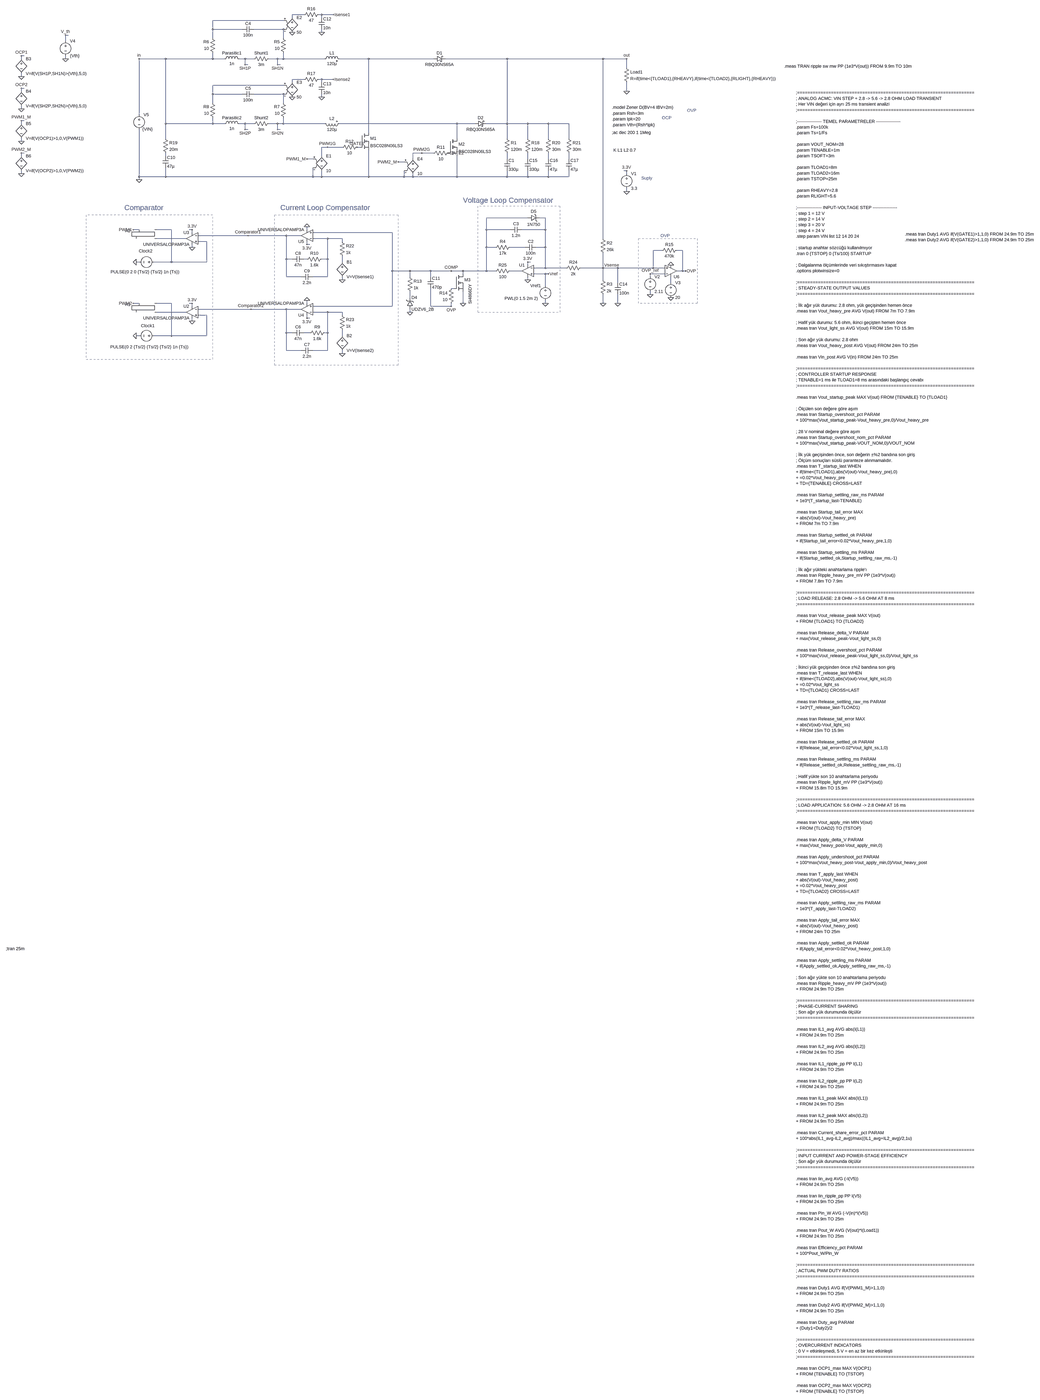
[diagram p0: schematic Konferans ACMC.asc, whole sheet]
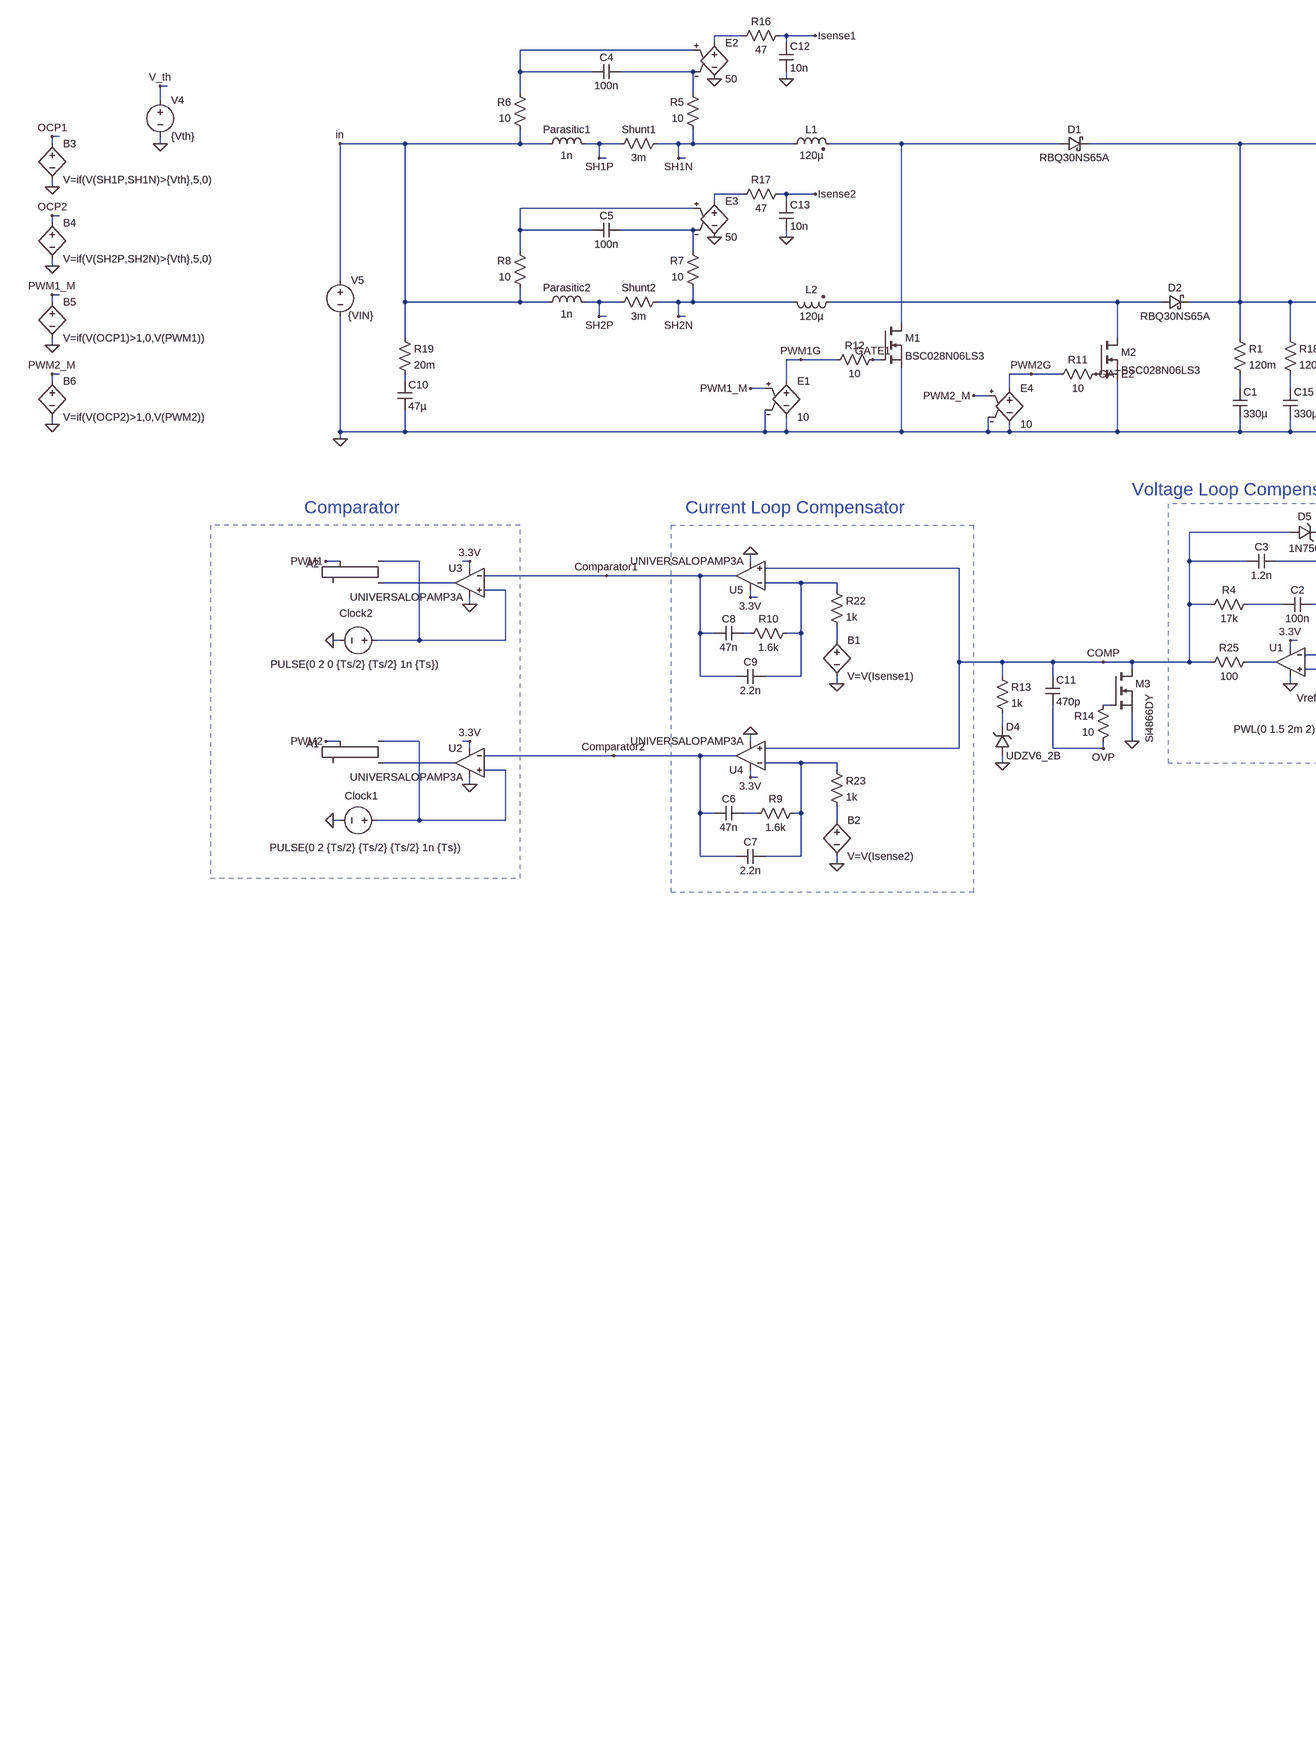
[diagram p1: schematic Konferans ACMC.asc, part, row 1 of 2, column 1 of 2]
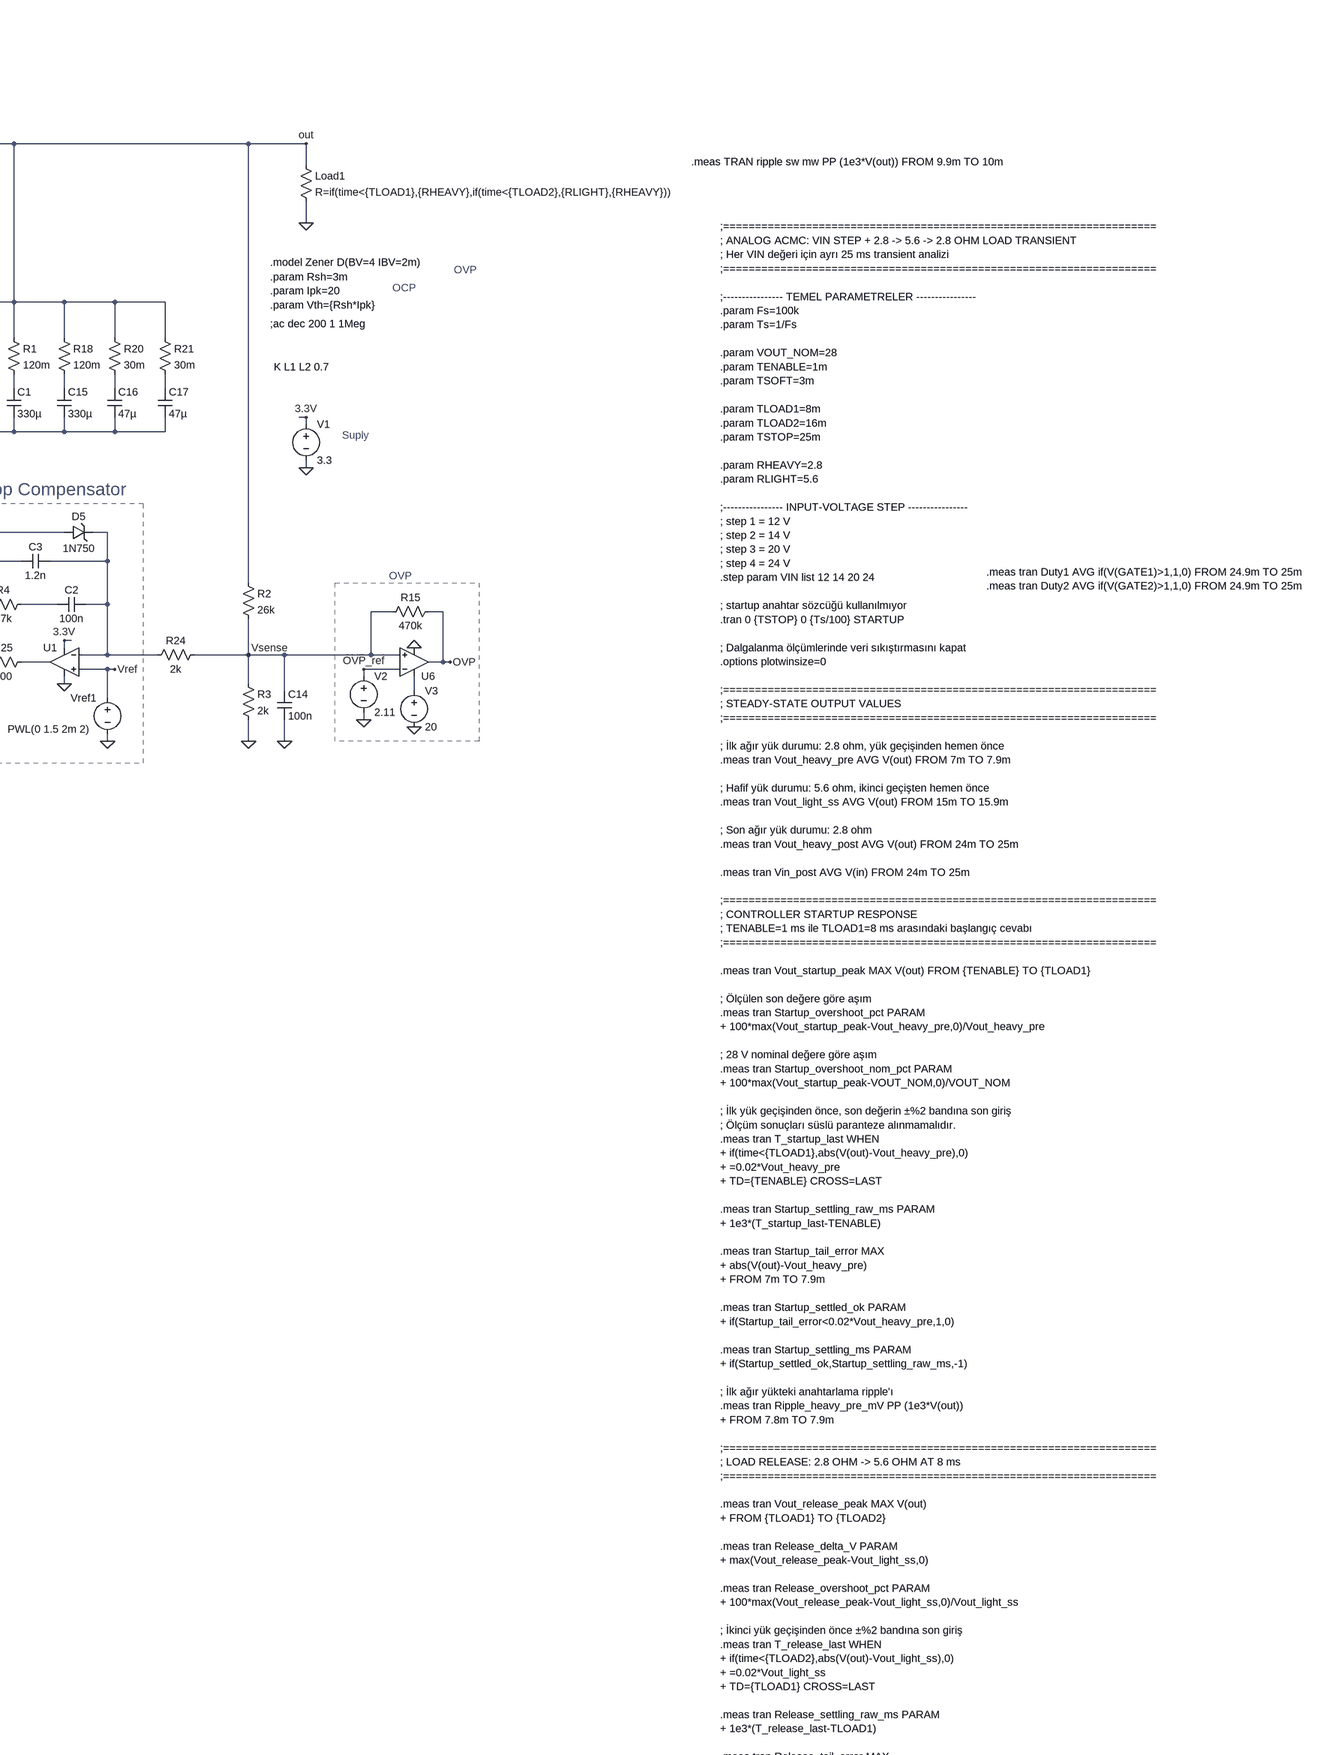
[diagram p2: schematic Konferans ACMC.asc, part, row 1 of 2, column 2 of 2]
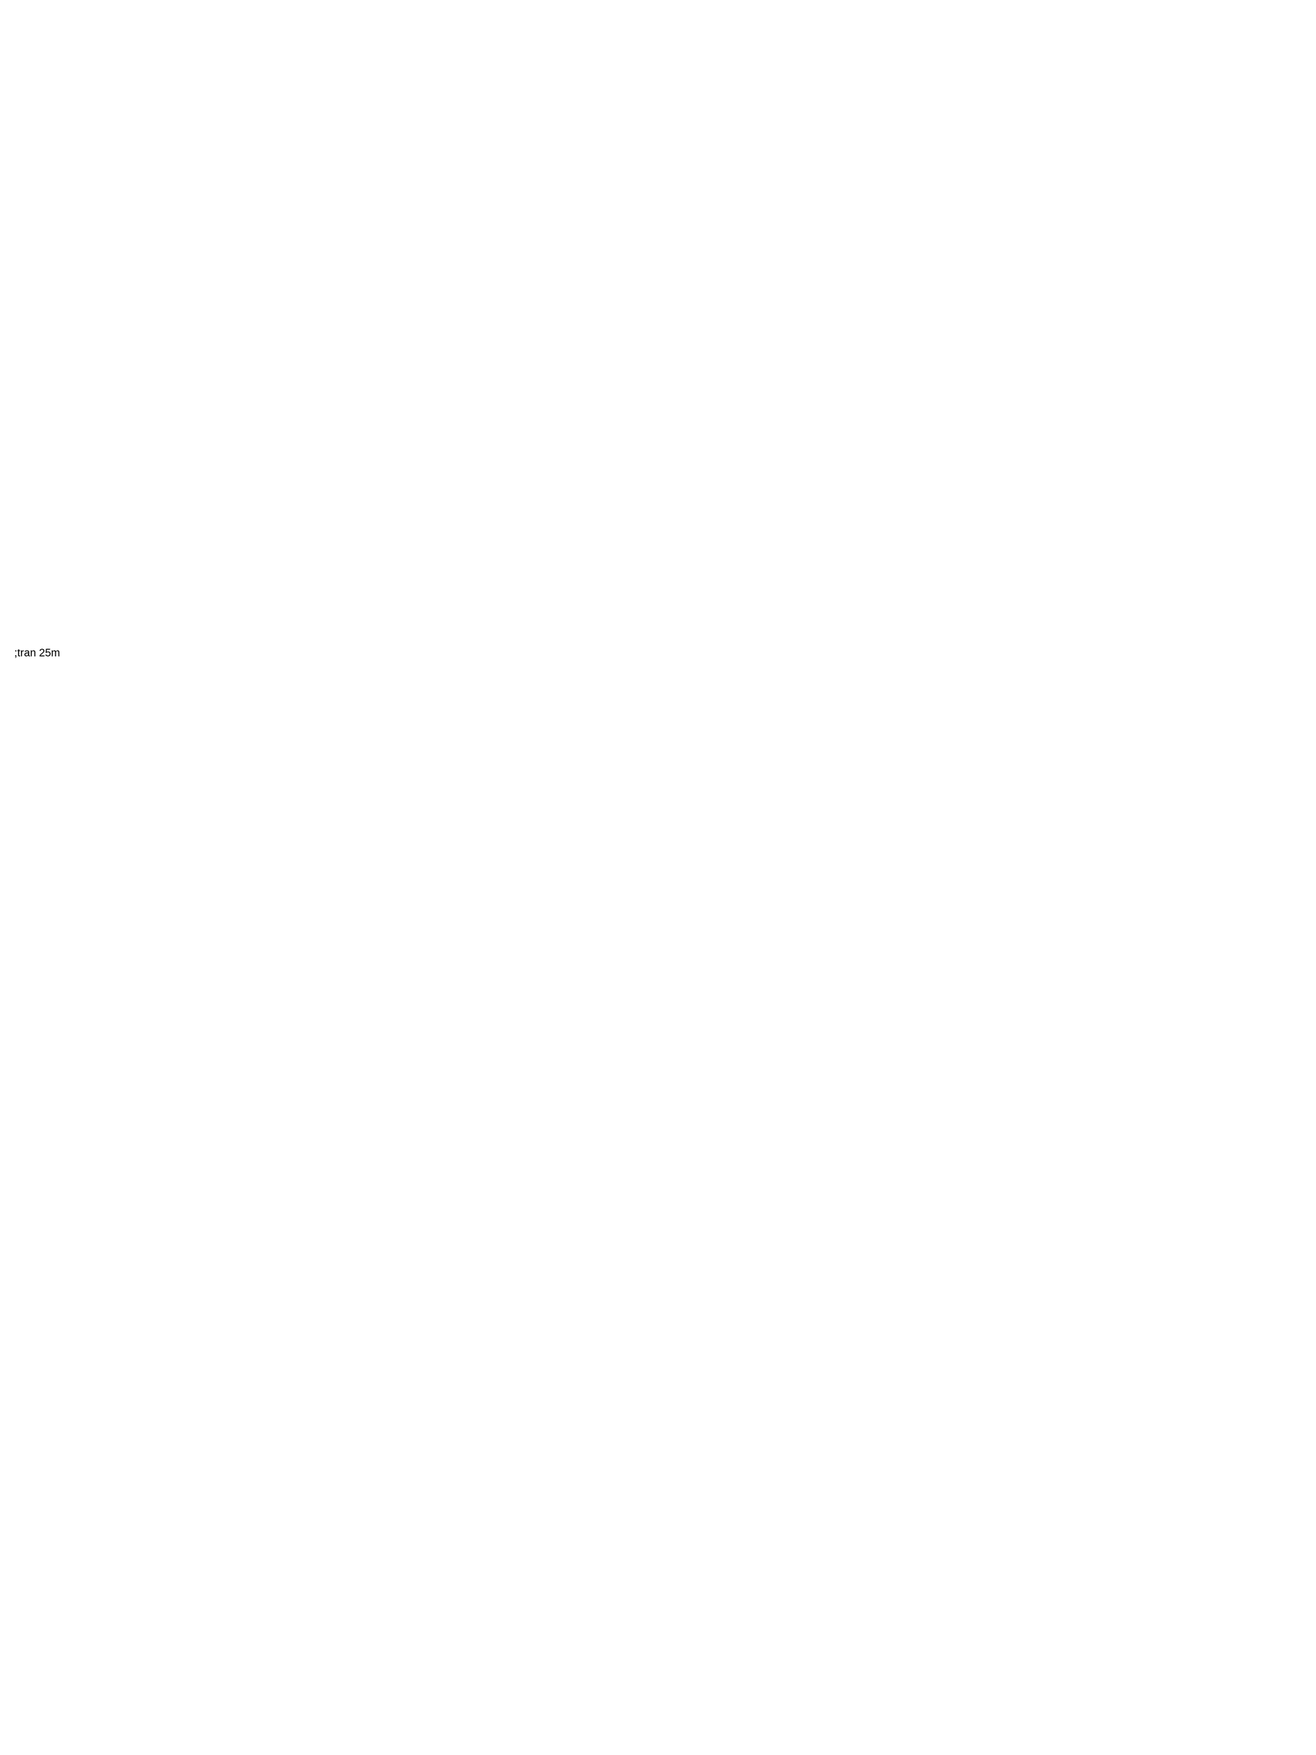
[diagram p3: schematic Konferans ACMC.asc, part, row 2 of 2, column 1 of 2]
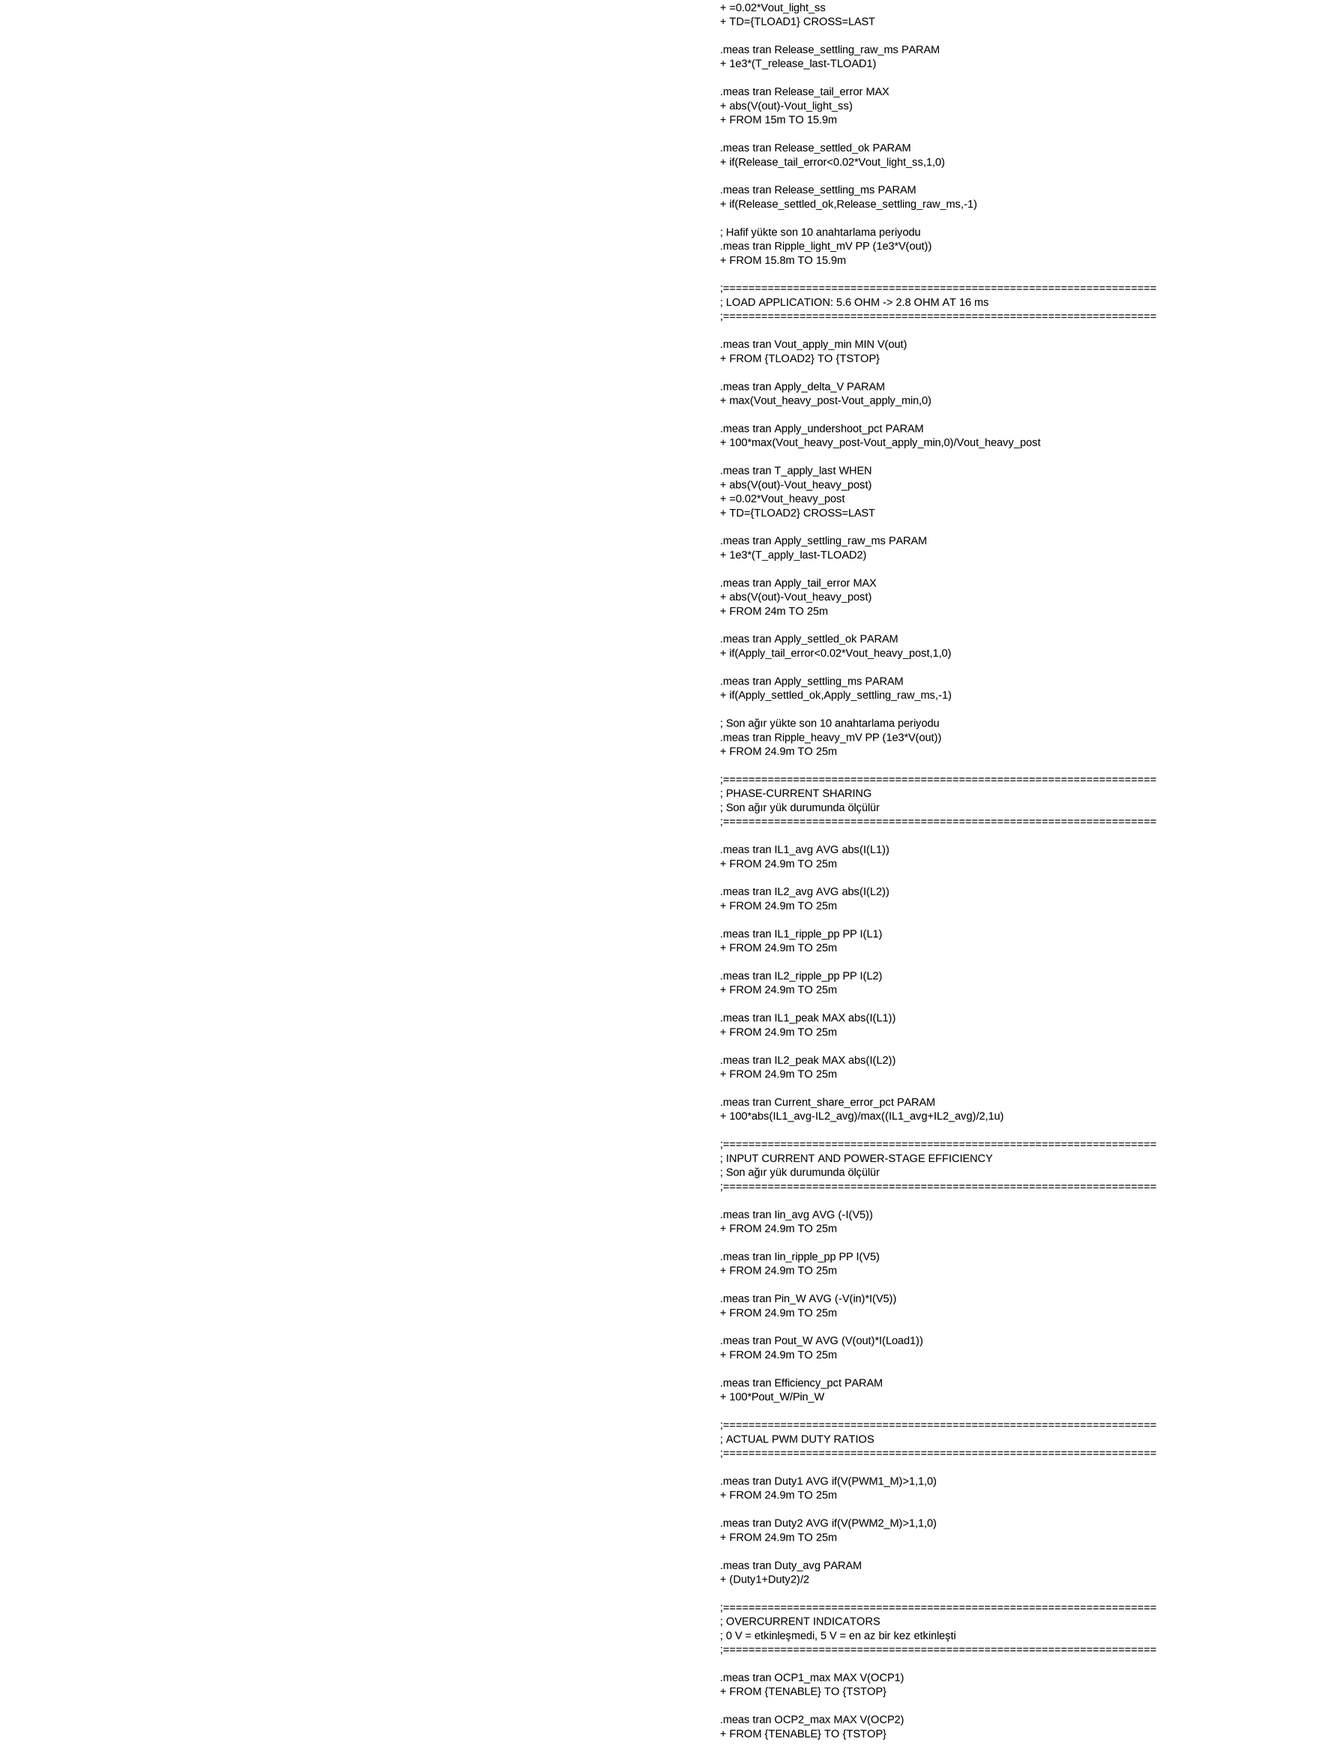
[diagram p4: schematic Konferans ACMC.asc, part, row 2 of 2, column 2 of 2]
Konferans ACMC.asc, the LTspice schematic file:
Version 4
SHEET 1 4208 6960
WIRE -80 -1168 -144 -1168
WIRE 16 -1168 0 -1168
WIRE 80 -1168 16 -1168
WIRE -144 -1152 -144 -1168
WIRE 16 -1152 16 -1168
WIRE -192 -1136 -576 -1136
WIRE -576 -1088 -576 -1136
WIRE -416 -1088 -576 -1088
WIRE -192 -1088 -352 -1088
WIRE 16 -1072 16 -1088
WIRE -1360 -1056 -1376 -1056
WIRE -576 -1040 -576 -1088
WIRE -192 -1040 -192 -1088
WIRE -1376 -1024 -1376 -1056
WIRE -1600 -944 -1616 -944
WIRE -1616 -928 -1616 -944
WIRE -1376 -928 -1376 -944
WIRE -832 -928 -976 -928
WIRE -576 -928 -576 -960
WIRE -576 -928 -832 -928
WIRE -512 -928 -576 -928
WIRE -400 -928 -432 -928
WIRE -352 -928 -400 -928
WIRE -224 -928 -272 -928
WIRE -192 -928 -192 -960
WIRE -192 -928 -224 -928
WIRE 32 -928 -192 -928
WIRE 272 -928 112 -928
WIRE 624 -928 272 -928
WIRE 1024 -928 688 -928
WIRE 1552 -928 1024 -928
WIRE 1680 -928 1552 -928
WIRE -400 -896 -400 -928
WIRE -384 -896 -400 -896
WIRE -224 -896 -224 -928
WIRE -208 -896 -224 -896
WIRE 1680 -880 1680 -928
WIRE -1616 -832 -1616 -848
WIRE -80 -816 -144 -816
WIRE 16 -816 0 -816
WIRE 80 -816 16 -816
WIRE -144 -800 -144 -816
WIRE 16 -800 16 -816
WIRE -192 -784 -576 -784
WIRE -1600 -768 -1616 -768
WIRE -1616 -752 -1616 -768
WIRE 1680 -752 1680 -800
WIRE -576 -736 -576 -784
WIRE -416 -736 -576 -736
WIRE -192 -736 -352 -736
WIRE 16 -720 16 -736
WIRE -576 -688 -576 -736
WIRE -192 -688 -192 -736
WIRE -1616 -656 -1616 -672
WIRE -976 -624 -976 -928
WIRE -1600 -592 -1616 -592
WIRE -1616 -576 -1616 -592
WIRE -832 -576 -832 -928
WIRE -576 -576 -576 -608
WIRE -576 -576 -832 -576
WIRE -512 -576 -576 -576
WIRE -400 -576 -432 -576
WIRE -352 -576 -400 -576
WIRE -224 -576 -272 -576
WIRE -192 -576 -192 -608
WIRE -192 -576 -224 -576
WIRE 32 -576 -192 -576
WIRE 752 -576 112 -576
WIRE 848 -576 752 -576
WIRE 1024 -576 1024 -928
WIRE 1024 -576 912 -576
WIRE 1136 -576 1024 -576
WIRE 1248 -576 1136 -576
WIRE 1360 -576 1248 -576
WIRE -400 -544 -400 -576
WIRE -384 -544 -400 -544
WIRE -224 -544 -224 -576
WIRE -208 -544 -224 -544
WIRE 272 -528 272 -928
WIRE -832 -496 -832 -576
WIRE 752 -496 752 -576
WIRE 1024 -496 1024 -576
WIRE 1136 -496 1136 -576
WIRE 1248 -496 1248 -576
WIRE 1360 -496 1360 -576
WIRE -1616 -480 -1616 -496
WIRE 48 -448 16 -448
WIRE 128 -448 48 -448
WIRE 224 -448 208 -448
WIRE -1600 -416 -1616 -416
WIRE 560 -416 512 -416
WIRE 624 -416 560 -416
WIRE -1616 -400 -1616 -416
WIRE -832 -400 -832 -416
WIRE 16 -400 16 -448
WIRE -32 -384 -64 -384
WIRE 512 -384 512 -416
WIRE 1024 -384 1024 -416
WIRE 1136 -384 1136 -416
WIRE 1248 -384 1248 -416
WIRE 1360 -384 1360 -416
WIRE 464 -368 432 -368
WIRE 1680 -320 1664 -320
WIRE -1616 -304 -1616 -320
WIRE 1680 -304 1680 -320
WIRE -976 -288 -976 -544
WIRE -832 -288 -832 -336
WIRE -832 -288 -976 -288
WIRE -32 -288 -32 -336
WIRE -32 -288 -832 -288
WIRE 16 -288 16 -320
WIRE 16 -288 -32 -288
WIRE 272 -288 272 -432
WIRE 272 -288 16 -288
WIRE 464 -288 464 -320
WIRE 464 -288 272 -288
WIRE 512 -288 512 -304
WIRE 512 -288 464 -288
WIRE 752 -288 752 -400
WIRE 752 -288 512 -288
WIRE 1024 -288 1024 -320
WIRE 1024 -288 752 -288
WIRE 1136 -288 1136 -320
WIRE 1136 -288 1024 -288
WIRE 1248 -288 1248 -320
WIRE 1248 -288 1136 -288
WIRE 1360 -288 1360 -320
WIRE 1360 -288 1248 -288
WIRE -976 -272 -976 -288
WIRE 1680 -208 1680 -224
WIRE 1136 -64 912 -64
WIRE 1232 -64 1200 -64
WIRE -976 0 -1008 0
WIRE -800 0 -880 0
WIRE -688 0 -704 0
WIRE -64 0 -64 -16
WIRE 912 0 912 -64
WIRE 1040 0 912 0
WIRE 1232 0 1232 -64
WIRE 1232 0 1104 0
WIRE -688 16 -688 0
WIRE 400 16 -32 16
WIRE -384 32 -656 32
WIRE -176 32 -384 32
WIRE -96 32 -176 32
WIRE -720 48 -880 48
WIRE 48 48 -32 48
WIRE 128 48 48 48
WIRE 1552 48 1552 -928
WIRE -608 64 -656 64
WIRE 128 64 128 48
WIRE -64 80 -64 64
WIRE -48 80 -64 80
WIRE -688 96 -688 80
WIRE 912 96 912 0
WIRE 960 96 912 96
WIRE 1120 96 1040 96
WIRE 1232 96 1232 0
WIRE 1232 96 1184 96
WIRE 1872 112 1824 112
WIRE 1984 112 1952 112
WIRE -176 160 -176 32
WIRE -144 160 -176 160
WIRE -64 160 -80 160
WIRE 48 160 48 48
WIRE 48 160 16 160
WIRE -976 176 -992 176
WIRE -800 176 -800 0
WIRE -800 176 -896 176
WIRE -608 176 -608 64
WIRE -608 176 -800 176
WIRE 128 176 128 144
WIRE 1152 176 1136 176
WIRE 1136 192 1136 176
WIRE 1232 208 1232 96
WIRE 1232 208 1168 208
WIRE 1344 208 1232 208
WIRE 1552 208 1552 128
WIRE 1552 208 1424 208
WIRE 1632 208 1552 208
WIRE 1824 208 1824 112
WIRE 1824 208 1632 208
WIRE 1888 208 1824 208
WIRE 1920 208 1920 192
WIRE 400 224 400 16
WIRE 496 224 400 224
WIRE 608 224 496 224
WIRE 720 224 608 224
WIRE 784 224 720 224
WIRE 912 224 912 96
WIRE 912 224 784 224
WIRE 960 224 912 224
WIRE 1104 224 1040 224
WIRE 1984 224 1984 112
WIRE 1984 224 1952 224
WIRE 2000 224 1984 224
WIRE 784 240 784 224
WIRE 1232 240 1168 240
WIRE 1248 240 1232 240
WIRE 1888 240 1808 240
WIRE -176 256 -176 160
WIRE -96 256 -176 256
WIRE 48 256 48 160
WIRE 48 256 -32 256
WIRE 496 256 496 224
WIRE 608 256 608 224
WIRE 1808 256 1808 240
WIRE 128 272 128 256
WIRE 1136 272 1136 256
WIRE 1552 272 1552 208
WIRE 1632 288 1632 208
WIRE 1920 288 1920 256
WIRE 1232 304 1232 240
WIRE 736 320 720 320
WIRE 1808 352 1808 336
WIRE 496 368 496 336
WIRE -976 400 -1008 400
WIRE -800 400 -880 400
WIRE -688 400 -704 400
WIRE -64 400 -64 384
WIRE 784 400 784 336
WIRE 1232 400 1232 384
WIRE 1552 400 1552 352
WIRE 1632 400 1632 352
WIRE -688 416 -688 400
WIRE 400 416 400 224
WIRE 400 416 -32 416
WIRE 608 416 608 320
WIRE 720 416 720 400
WIRE 720 416 608 416
WIRE -368 432 -656 432
WIRE -176 432 -368 432
WIRE -96 432 -176 432
WIRE -720 448 -880 448
WIRE 48 448 -32 448
WIRE 128 448 48 448
WIRE 496 448 496 432
WIRE -608 464 -656 464
WIRE 128 464 128 448
WIRE -64 480 -64 464
WIRE -48 480 -64 480
WIRE -688 496 -688 480
WIRE -176 560 -176 432
WIRE -144 560 -176 560
WIRE -48 560 -80 560
WIRE 48 560 48 448
WIRE 48 560 32 560
WIRE -976 576 -992 576
WIRE -800 576 -800 400
WIRE -800 576 -896 576
WIRE -608 576 -608 464
WIRE -608 576 -800 576
WIRE 128 576 128 544
WIRE -176 656 -176 560
WIRE -96 656 -176 656
WIRE 48 656 48 560
WIRE 48 656 -32 656
WIRE 128 672 128 656
FLAG -976 -272 0
FLAG 1680 -928 out
FLAG 1552 400 0
FLAG 1680 -208 0
FLAG 1232 400 0
FLAG 1680 -320 3.3V
FLAG 1136 272 0
FLAG -144 -1072 0
FLAG -992 576 0
FLAG 1680 -752 0
FLAG 80 -1168 Isense1
FLAG -688 496 0
FLAG -144 -720 0
FLAG 80 -816 Isense2
FLAG -688 96 0
FLAG -992 176 0
FLAG 128 272 0
FLAG 128 672 0
FLAG -64 384 0
FLAG -64 -16 0
FLAG 1248 240 Vref
FLAG 1552 208 Vsense
FLAG -1008 0 PWM1
FLAG -1008 400 PWM2
FLAG -64 -384 PWM1_M
FLAG 432 -368 PWM2_M
FLAG 496 448 0
FLAG 1136 176 3.3V
FLAG -64 80 3.3V
FLAG -64 480 3.3V
FLAG -688 0 3.3V
FLAG -688 400 3.3V
FLAG 1920 192 0
FLAG 2000 224 OVP
FLAG 784 400 0
FLAG 1808 352 0
FLAG 1808 240 OVP_ref
FLAG 1920 368 0
FLAG 720 416 OVP
FLAG 16 -1072 0
FLAG 16 -720 0
FLAG 48 -448 PWM1G
FLAG 560 -416 PWM2G
FLAG -400 -896 SH1P
FLAG -224 -896 SH1N
FLAG -400 -544 SH2P
FLAG -224 -544 SH2N
FLAG -1616 -832 0
FLAG -1616 -656 0
FLAG -1616 -944 OCP1
FLAG -1616 -768 OCP2
FLAG -1616 -480 0
FLAG -1616 -304 0
FLAG -1616 -592 PWM1_M
FLAG -1616 -416 PWM2_M
FLAG -1376 -928 0
FLAG -1376 -1056 V_th
FLAG 720 224 COMP
FLAG 1632 400 0
FLAG -976 -928 in
FLAG -384 32 Comparator1
FLAG -368 432 Comparator2
FLAG 208 -448 GATE1
FLAG 704 -416 GATE2
SYMBOL res 1664 -896 R0
SYMATTR InstName Load1
SYMATTR Value R=if(time<{TLOAD1},{RHEAVY},if(time<{TLOAD2},{RLIGHT},{RHEAVY}))
SYMBOL nmos 224 -528 R0
SYMATTR InstName M1
SYMATTR Value BSC028N06LS3
SYMBOL ind2 16 -912 R270
WINDOW 0 32 56 VTop 2
WINDOW 3 5 56 VBottom 2
SYMATTR InstName L1
SYMATTR Value 120µ
SYMATTR Type ind
SYMATTR SpiceLine Rser=1u
SYMBOL res -368 -912 R270
WINDOW 0 32 56 VTop 2
WINDOW 3 0 56 VBottom 2
SYMATTR InstName Shunt1
SYMATTR Value 3m
SYMBOL res 1008 -512 R0
SYMATTR InstName R1
SYMATTR Value 120m
SYMBOL cap 1008 -384 R0
SYMATTR InstName C1
SYMATTR Value 330µ
SYMBOL e 16 -416 R0
SYMATTR InstName E1
SYMATTR Value 10
SYMBOL Digital\\srflop -928 352 M0
SYMATTR InstName A1
SYMBOL res 1536 32 R0
SYMATTR InstName R2
SYMATTR Value 26k
SYMBOL res 1536 256 R0
SYMATTR InstName R3
SYMATTR Value 2k
SYMBOL voltage 1680 -320 R0
WINDOW 123 0 0 Left 0
WINDOW 39 0 0 Left 0
SYMATTR InstName V1
SYMATTR Value 3.3
SYMBOL OpAmps\\UniversalOpAmp2 1136 224 M0
SYMATTR InstName U1
SYMBOL res 1056 80 R90
WINDOW 0 0 56 VBottom 2
WINDOW 3 32 56 VTop 2
SYMATTR InstName R4
SYMATTR Value 17k
SYMBOL cap 1184 80 R90
WINDOW 0 0 32 VBottom 2
WINDOW 3 32 32 VTop 2
SYMATTR InstName C2
SYMATTR Value 100n
SYMBOL cap 1040 16 R270
WINDOW 0 32 32 VTop 2
WINDOW 3 0 32 VBottom 2
SYMATTR InstName C3
SYMATTR Value 1.2n
SYMBOL ind -528 -912 R270
WINDOW 0 32 56 VTop 2
WINDOW 3 5 56 VBottom 2
SYMATTR InstName Parasitic1
SYMATTR Value 1n
SYMBOL res -176 -944 R180
WINDOW 0 36 76 Left 2
WINDOW 3 36 40 Left 2
SYMATTR InstName R5
SYMATTR Value 10
SYMBOL res -560 -944 R180
WINDOW 0 36 76 Left 2
WINDOW 3 36 40 Left 2
SYMATTR InstName R6
SYMATTR Value 10
SYMBOL cap -416 -1072 R270
WINDOW 0 32 32 VTop 2
WINDOW 3 0 32 VBottom 2
SYMATTR InstName C4
SYMATTR Value 100n
SYMBOL e -144 -1168 R0
SYMATTR InstName E2
SYMATTR Value 50
SYMBOL voltage -880 576 R90
WINDOW 0 -70 49 VTop 2
WINDOW 3 76 41 VBottom 2
WINDOW 123 0 0 Left 0
WINDOW 39 0 0 Left 0
SYMATTR InstName Clock1
SYMATTR Value PULSE(0 2 {Ts/2} {Ts/2} {Ts/2} 1n {Ts})
SYMBOL OpAmps\\UniversalOpAmp3a -688 448 M0
SYMATTR InstName U2
SYMBOL schottky 624 -912 R270
WINDOW 0 32 32 VTop 2
WINDOW 3 0 32 VBottom 2
SYMATTR InstName D1
SYMATTR Value RBQ30NS65A
SYMATTR Description Diode
SYMATTR Type diode
SYMBOL ind2 16 -592 M90
WINDOW 0 4 56 VBottom 2
WINDOW 3 32 56 VTop 2
SYMATTR InstName L2
SYMATTR Value 120µ
SYMATTR Type ind
SYMATTR SpiceLine Rser=1u
SYMBOL schottky 848 -560 R270
WINDOW 0 32 32 VTop 2
WINDOW 3 0 32 VBottom 2
SYMATTR InstName D2
SYMATTR Value RBQ30NS65A
SYMATTR Description Diode
SYMATTR Type diode
SYMBOL nmos 704 -496 R0
SYMATTR InstName M2
SYMATTR Value BSC028N06LS3
SYMBOL res -368 -560 R270
WINDOW 0 32 56 VTop 2
WINDOW 3 0 56 VBottom 2
SYMATTR InstName Shunt2
SYMATTR Value 3m
SYMBOL ind -528 -560 R270
WINDOW 0 32 56 VTop 2
WINDOW 3 5 56 VBottom 2
SYMATTR InstName Parasitic2
SYMATTR Value 1n
SYMBOL res -176 -592 R180
WINDOW 0 36 76 Left 2
WINDOW 3 36 40 Left 2
SYMATTR InstName R7
SYMATTR Value 10
SYMBOL res -560 -592 R180
WINDOW 0 36 76 Left 2
WINDOW 3 36 40 Left 2
SYMATTR InstName R8
SYMATTR Value 10
SYMBOL cap -416 -720 R270
WINDOW 0 32 32 VTop 2
WINDOW 3 0 32 VBottom 2
SYMATTR InstName C5
SYMATTR Value 100n
SYMBOL e -144 -816 R0
SYMATTR InstName E3
SYMATTR Value 50
SYMBOL OpAmps\\UniversalOpAmp3a -688 48 M0
SYMATTR InstName U3
SYMBOL bv 128 160 R0
SYMATTR InstName B1
SYMATTR Value V=V(Isense1)
SYMBOL Digital\\srflop -928 -48 M0
SYMATTR InstName A2
SYMBOL voltage -880 176 R90
WINDOW 0 -76 61 VTop 2
WINDOW 3 69 64 VBottom 2
WINDOW 123 0 0 Left 0
WINDOW 39 0 0 Left 0
SYMATTR InstName Clock2
SYMATTR Value PULSE(0 2 0 {Ts/2} {Ts/2} 1n {Ts})
SYMBOL e 512 -400 R0
SYMATTR InstName E4
SYMATTR Value 10
SYMBOL bv 128 560 R0
SYMATTR InstName B2
SYMATTR Value V=V(Isense2)
SYMBOL OpAmps\\UniversalOpAmp3a -64 432 R180
SYMATTR InstName U4
SYMBOL res -64 576 R270
WINDOW 0 32 56 VTop 2
WINDOW 3 0 56 VBottom 2
SYMATTR InstName R9
SYMATTR Value 1.6k
SYMBOL cap -144 576 R270
WINDOW 0 32 32 VTop 2
WINDOW 3 0 32 VBottom 2
SYMATTR InstName C6
SYMATTR Value 47n
SYMBOL cap -32 640 R90
WINDOW 0 0 32 VBottom 2
WINDOW 3 32 32 VTop 2
SYMATTR InstName C7
SYMATTR Value 2.2n
SYMBOL OpAmps\\UniversalOpAmp3a -64 32 R180
SYMATTR InstName U5
SYMBOL res -80 176 R270
WINDOW 0 32 56 VTop 2
WINDOW 3 0 56 VBottom 2
SYMATTR InstName R10
SYMATTR Value 1.6k
SYMBOL cap -144 176 R270
WINDOW 0 32 32 VTop 2
WINDOW 3 0 32 VBottom 2
SYMATTR InstName C8
SYMATTR Value 47n
SYMBOL cap -32 240 R90
WINDOW 0 0 32 VBottom 2
WINDOW 3 32 32 VTop 2
SYMATTR InstName C9
SYMATTR Value 2.2n
SYMBOL res 720 -432 R90
WINDOW 0 0 56 VBottom 2
WINDOW 3 32 56 VTop 2
SYMATTR InstName R11
SYMATTR Value 10
SYMBOL res 224 -464 R90
WINDOW 0 0 56 VBottom 2
WINDOW 3 32 56 VTop 2
SYMATTR InstName R12
SYMATTR Value 10
SYMBOL cap -848 -400 R0
SYMATTR InstName C10
SYMATTR Value 47µ
SYMBOL res 480 240 R0
SYMATTR InstName R13
SYMATTR Value 1k
SYMBOL voltage 1232 288 M0
WINDOW 123 0 0 Left 0
WINDOW 39 0 0 Left 0
WINDOW 3 39 85 Left 2
SYMATTR Value PWL(0 1.5 2m 2)
SYMATTR InstName Vref1
SYMBOL OpAmps\\UniversalOpAmp2 1920 224 M180
SYMATTR InstName U6
SYMBOL zener 480 432 M180
WINDOW 0 24 64 Left 2
WINDOW 3 24 0 Left 2
SYMATTR InstName D4
SYMATTR Value UDZV6_2B
SYMATTR Description Diode
SYMATTR Type diode
SYMBOL nmos 736 240 R0
WINDOW 3 87 56 VRight 2
SYMATTR Value Si4866DY
SYMATTR InstName M3
SYMBOL voltage 1808 240 R0
WINDOW 123 0 0 Left 0
WINDOW 39 0 0 Left 0
SYMATTR InstName V2
SYMATTR Value 2.11
SYMBOL res 736 304 M0
SYMATTR InstName R14
SYMATTR Value 10
SYMBOL cap 592 256 R0
SYMATTR InstName C11
SYMATTR Value 470p
SYMBOL voltage 1920 272 R0
WINDOW 123 0 0 Left 0
WINDOW 39 0 0 Left 0
SYMATTR InstName V3
SYMATTR Value 20
SYMBOL res 1968 96 R90
WINDOW 0 0 56 VBottom 2
WINDOW 3 32 56 VTop 2
SYMATTR InstName R15
SYMATTR Value 470k
SYMBOL res 16 -1184 R90
WINDOW 0 0 56 VBottom 2
WINDOW 3 32 56 VTop 2
SYMATTR InstName R16
SYMATTR Value 47
SYMBOL cap 0 -1152 R0
SYMATTR InstName C12
SYMATTR Value 10n
SYMBOL cap 0 -800 R0
SYMATTR InstName C13
SYMATTR Value 10n
SYMBOL res 16 -832 R90
WINDOW 0 0 56 VBottom 2
WINDOW 3 32 56 VTop 2
SYMATTR InstName R17
SYMATTR Value 47
SYMBOL bv -1616 -944 R0
SYMATTR InstName B3
SYMATTR Value V=if(V(SH1P,SH1N)>{Vth},5,0)
SYMBOL bv -1616 -768 R0
SYMATTR InstName B4
SYMATTR Value V=if(V(SH2P,SH2N)>{Vth},5,0)
SYMBOL bv -1616 -592 R0
SYMATTR InstName B5
SYMATTR Value V=if(V(OCP1)>1,0,V(PWM1))
SYMBOL bv -1616 -416 R0
SYMATTR InstName B6
SYMATTR Value V=if(V(OCP2)>1,0,V(PWM2))
SYMBOL voltage -1376 -1040 R0
SYMATTR InstName V4
SYMATTR Value {Vth}
SYMBOL res -848 -512 R0
SYMATTR InstName R19
SYMATTR Value 20m
SYMBOL voltage -976 -640 R0
WINDOW 123 24 50 Left 2
WINDOW 39 0 0 Left 0
WINDOW 3 18 94 Left 2
SYMATTR Value {VIN}
SYMATTR InstName V5
SYMBOL cap 1616 288 R0
SYMATTR InstName C14
SYMATTR Value 100n
SYMBOL res 1120 -512 R0
SYMATTR InstName R18
SYMATTR Value 120m
SYMBOL cap 1120 -384 R0
SYMATTR InstName C15
SYMATTR Value 330µ
SYMBOL res 1232 -512 R0
SYMATTR InstName R20
SYMATTR Value 30m
SYMBOL cap 1232 -384 R0
SYMATTR InstName C16
SYMATTR Value 47µ
SYMBOL res 1344 -512 R0
SYMATTR InstName R21
SYMATTR Value 30m
SYMBOL cap 1344 -384 R0
SYMATTR InstName C17
SYMATTR Value 47µ
SYMBOL zener 1136 -48 R270
WINDOW 0 36 32 VTop 2
WINDOW 3 -4 32 VBottom 2
SYMATTR InstName D5
SYMATTR Value 1N750
SYMBOL res 112 48 R0
SYMATTR InstName R22
SYMATTR Value 1k
SYMBOL res 112 448 R0
SYMATTR InstName R23
SYMATTR Value 1k
SYMBOL res 1440 192 R90
WINDOW 0 0 56 VBottom 2
WINDOW 3 32 56 VTop 2
SYMATTR InstName R24
SYMATTR Value 2k
SYMBOL res 1056 208 R90
WINDOW 0 0 56 VBottom 2
WINDOW 3 32 56 VTop 2
SYMATTR InstName R25
SYMATTR Value 100
TEXT 1600 -528 Left 2 !;ac dec 200 1 1Meg
TEXT 1608 -432 Left 2 !K L1 L2 0.7
TEXT -1056 -120 Left 4 ;Comparator
TEXT -208 -120 Left 4 ;Current Loop Compensator
TEXT 784 -160 Left 4 ;Voltage Loop Compensator
TEXT 1600 -664 Left 2 !.model Zener D(BV=4 IBV=2m)
TEXT 1864 32 Left 2 ;OVP
TEXT 1872 -608 Left 2 ;OCP
TEXT 2008 -648 Left 2 ;OVP
TEXT 1760 -280 Left 2 ;Suply
TEXT 1600 -632 Left 2 !.param Rsh=3m\n.param Ipk=20\n.param Vth={Rsh*Ipk}
TEXT 2600 -744 Left 2 !;====================================================================\n; ANALOG ACMC: VIN STEP + 2.8 -> 5.6 -> 2.8 OHM LOAD TRANSIENT\n; Her VIN değeri için ayrı 25 ms transient analizi\n;====================================================================\n \n;---------------- TEMEL PARAMETRELER ----------------\n.param Fs=100k\n.param Ts=1/Fs\n \n.param VOUT_NOM=28\n.param TENABLE=1m\n.param TSOFT=3m\n \n.param TLOAD1=8m\n.param TLOAD2=16m\n.param TSTOP=25m\n \n.param RHEAVY=2.8\n.param RLIGHT=5.6\n \n;---------------- INPUT-VOLTAGE STEP ----------------\n; step 1 = 12 V\n; step 2 = 14 V\n; step 3 = 20 V\n; step 4 = 24 V\n.step param VIN list 12 14 20 24\n \n; startup anahtar sözcüğü kullanılmıyor\n.tran 0 {TSTOP} 0 {Ts/100} STARTUP\n \n; Dalgalanma ölçümlerinde veri sıkıştırmasını kapat\n.options plotwinsize=0\n \n;====================================================================\n; STEADY-STATE OUTPUT VALUES\n;====================================================================\n \n; İlk ağır yük durumu: 2.8 ohm, yük geçişinden hemen önce\n.meas tran Vout_heavy_pre AVG V(out) FROM 7m TO 7.9m\n \n; Hafif yük durumu: 5.6 ohm, ikinci geçişten hemen önce\n.meas tran Vout_light_ss AVG V(out) FROM 15m TO 15.9m\n \n; Son ağır yük durumu: 2.8 ohm\n.meas tran Vout_heavy_post AVG V(out) FROM 24m TO 25m\n \n.meas tran Vin_post AVG V(in) FROM 24m TO 25m\n \n;====================================================================\n; CONTROLLER STARTUP RESPONSE\n; TENABLE=1 ms ile TLOAD1=8 ms arasındaki başlangıç cevabı\n;====================================================================\n \n.meas tran Vout_startup_peak MAX V(out) FROM {TENABLE} TO {TLOAD1}\n \n; Ölçülen son değere göre aşım\n.meas tran Startup_overshoot_pct PARAM\n+ 100*max(Vout_startup_peak-Vout_heavy_pre,0)/Vout_heavy_pre\n \n; 28 V nominal değere göre aşım\n.meas tran Startup_overshoot_nom_pct PARAM\n+ 100*max(Vout_startup_peak-VOUT_NOM,0)/VOUT_NOM\n \n; İlk yük geçişinden önce, son değerin ±%2 bandına son giriş\n; Ölçüm sonuçları süslü paranteze alınmamalıdır.\n.meas tran T_startup_last WHEN\n+ if(time<{TLOAD1},abs(V(out)-Vout_heavy_pre),0)\n+ =0.02*Vout_heavy_pre\n+ TD={TENABLE} CROSS=LAST\n \n.meas tran Startup_settling_raw_ms PARAM\n+ 1e3*(T_startup_last-TENABLE)\n \n.meas tran Startup_tail_error MAX\n+ abs(V(out)-Vout_heavy_pre)\n+ FROM 7m TO 7.9m\n \n.meas tran Startup_settled_ok PARAM\n+ if(Startup_tail_error<0.02*Vout_heavy_pre,1,0)\n \n.meas tran Startup_settling_ms PARAM\n+ if(Startup_settled_ok,Startup_settling_raw_ms,-1)\n \n; İlk ağır yükteki anahtarlama ripple'ı\n.meas tran Ripple_heavy_pre_mV PP (1e3*V(out))\n+ FROM 7.8m TO 7.9m\n \n;====================================================================\n; LOAD RELEASE: 2.8 OHM -> 5.6 OHM AT 8 ms\n;====================================================================\n \n.meas tran Vout_release_peak MAX V(out)\n+ FROM {TLOAD1} TO {TLOAD2}\n \n.meas tran Release_delta_V PARAM\n+ max(Vout_release_peak-Vout_light_ss,0)\n \n.meas tran Release_overshoot_pct PARAM\n+ 100*max(Vout_release_peak-Vout_light_ss,0)/Vout_light_ss\n \n; İkinci yük geçişinden önce ±%2 bandına son giriş\n.meas tran T_release_last WHEN\n+ if(time<{TLOAD2},abs(V(out)-Vout_light_ss),0)\n+ =0.02*Vout_light_ss\n+ TD={TLOAD1} CROSS=LAST\n \n.meas tran Release_settling_raw_ms PARAM\n+ 1e3*(T_release_last-TLOAD1)\n \n.meas tran Release_tail_error MAX\n+ abs(V(out)-Vout_light_ss)\n+ FROM 15m TO 15.9m\n \n.meas tran Release_settled_ok PARAM\n+ if(Release_tail_error<0.02*Vout_light_ss,1,0)\n \n.meas tran Release_settling_ms PARAM\n+ if(Release_settled_ok,Release_settling_raw_ms,-1)\n \n; Hafif yükte son 10 anahtarlama periyodu\n.meas tran Ripple_light_mV PP (1e3*V(out))\n+ FROM 15.8m TO 15.9m\n \n;====================================================================\n; LOAD APPLICATION: 5.6 OHM -> 2.8 OHM AT 16 ms\n;====================================================================\n \n.meas tran Vout_apply_min MIN V(out)\n+ FROM {TLOAD2} TO {TSTOP}\n \n.meas tran Apply_delta_V PARAM\n+ max(Vout_heavy_post-Vout_apply_min,0)\n \n.meas tran Apply_undershoot_pct PARAM\n+ 100*max(Vout_heavy_post-Vout_apply_min,0)/Vout_heavy_post\n \n.meas tran T_apply_last WHEN\n+ abs(V(out)-Vout_heavy_post)\n+ =0.02*Vout_heavy_post\n+ TD={TLOAD2} CROSS=LAST\n \n.meas tran Apply_settling_raw_ms PARAM\n+ 1e3*(T_apply_last-TLOAD2)\n \n.meas tran Apply_tail_error MAX\n+ abs(V(out)-Vout_heavy_post)\n+ FROM 24m TO 25m\n \n.meas tran Apply_settled_ok PARAM\n+ if(Apply_tail_error<0.02*Vout_heavy_post,1,0)\n \n.meas tran Apply_settling_ms PARAM\n+ if(Apply_settled_ok,Apply_settling_raw_ms,-1)\n \n; Son ağır yükte son 10 anahtarlama periyodu\n.meas tran Ripple_heavy_mV PP (1e3*V(out))\n+ FROM 24.9m TO 25m\n \n;====================================================================\n; PHASE-CURRENT SHARING\n; Son ağır yük durumunda ölçülür\n;====================================================================\n \n.meas tran IL1_avg AVG abs(I(L1))\n+ FROM 24.9m TO 25m\n \n.meas tran IL2_avg AVG abs(I(L2))\n+ FROM 24.9m TO 25m\n \n.meas tran IL1_ripple_pp PP I(L1)\n+ FROM 24.9m TO 25m\n \n.meas tran IL2_ripple_pp PP I(L2)\n+ FROM 24.9m TO 25m\n \n.meas tran IL1_peak MAX abs(I(L1))\n+ FROM 24.9m TO 25m\n \n.meas tran IL2_peak MAX abs(I(L2))\n+ FROM 24.9m TO 25m\n \n.meas tran Current_share_error_pct PARAM\n+ 100*abs(IL1_avg-IL2_avg)/max((IL1_avg+IL2_avg)/2,1u)\n \n;====================================================================\n; INPUT CURRENT AND POWER-STAGE EFFICIENCY\n; Son ağır yük durumunda ölçülür\n;====================================================================\n \n.meas tran Iin_avg AVG (-I(V5))\n+ FROM 24.9m TO 25m\n \n.meas tran Iin_ripple_pp PP I(V5)\n+ FROM 24.9m TO 25m\n \n.meas tran Pin_W AVG (-V(in)*I(V5))\n+ FROM 24.9m TO 25m\n \n.meas tran Pout_W AVG (V(out)*I(Load1))\n+ FROM 24.9m TO 25m\n \n.meas tran Efficiency_pct PARAM\n+ 100*Pout_W/Pin_W\n \n;====================================================================\n; ACTUAL PWM DUTY RATIOS\n;====================================================================\n \n.meas tran Duty1 AVG if(V(PWM1_M)>1,1,0)\n+ FROM 24.9m TO 25m\n \n.meas tran Duty2 AVG if(V(PWM2_M)>1,1,0)\n+ FROM 24.9m TO 25m\n \n.meas tran Duty_avg PARAM\n+ (Duty1+Duty2)/2\n \n;====================================================================\n; OVERCURRENT INDICATORS\n; 0 V = etkinleşmedi, 5 V = en az bir kez etkinleşti\n;====================================================================\n \n.meas tran OCP1_max MAX V(OCP1)\n+ FROM {TENABLE} TO {TSTOP}\n \n.meas tran OCP2_max MAX V(OCP2)\n+ FROM {TENABLE} TO {TSTOP}
TEXT 2536 -888 Left 2 !.meas TRAN ripple sw mw PP (1e3*V(out)) FROM 9.9m TO 10m
TEXT -1700 3904 Left 2 !;tran 25m
TEXT 3192 24 Left 2 !.meas tran Duty1 AVG if(V(GATE1)>1,1,0) FROM 24.9m TO 25m\n.meas tran Duty2 AVG if(V(GATE2)>1,1,0) FROM 24.9m TO 25m
RECTANGLE Normal 432 736 -240 -80 1
RECTANGLE Normal -1264 704 -576 -80 1
RECTANGLE Normal 2064 400 1744 48 2
RECTANGLE Normal 864 448 1312 -128 1

The netlist it stands for:
* Konferans ACMC.asc
R§Load1 out 0 R=if(time<{TLOAD1},{RHEAVY},if(time<{TLOAD2},{RLIGHT},{RHEAVY}))
M1 N004 GATE1 0 0 BSC028N06LS3
L1 SH1N N004 120µ Rser=1u
R§Shunt1 SH1P SH1N 3m
R1 out N010 120m
C1 N010 0 330µ
E1 PWM1G 0 PWM1_M 0 10
A1 N025 N026 0 0 0 0 PWM2 0 SRFLOP
R2 out Vsense 26k
R3 Vsense 0 2k
V1 3.3V 0 3.3
XU1 Vref N014 3.3V 0 N021 level2 Avol=1Meg GBW=10Meg Slew=10Meg Ilimit=25m Rail=0 Vos=0 En=0 Enk=0 In=0 Ink=0 Rin=500Meg  ; pins In+ In- V+ V- OUT
R4 N018 COMP 17k
C2 N014 N018 100n
C3 COMP N014 1.2n
L§Parasitic1 in SH1P 1n
R5 SH1N N003 10
R6 in N002 10
C4 N002 N003 100n
E2 N001 0 N002 N003 50
V§Clock1 N025 0 PULSE(0 2 {Ts/2} {Ts/2} {Ts/2} 1n {Ts})
XU2 N025 Comparator2 3.3V 0 N026 level3a Avol=1Meg GBW=10Meg Slew=10Meg Ilimit=25m Rail=0 Vos=0 Phimargin=45 En=0 Enk=0 In=0 Ink=0 Rin=500Meg  ; UNIVERSALOPAMP3A, pins In+ In- V+ V- OUT
D1 N004 out RBQ30NS65A
L2 SH2N N008 120µ Rser=1u
D2 N008 out RBQ30NS65A
M2 N008 GATE2 0 0 BSC028N06LS3
R§Shunt2 SH2P SH2N 3m
L§Parasitic2 in SH2P 1n
R7 SH2N N007 10
R8 in N006 10
C5 N006 N007 100n
E3 N005 0 N006 N007 50
XU3 N015 Comparator1 3.3V 0 N016 level3a Avol=1Meg GBW=10Meg Slew=10Meg Ilimit=25m Rail=0 Vos=0 Phimargin=45 En=0 Enk=0 In=0 Ink=0 Rin=500Meg  ; UNIVERSALOPAMP3A, pins In+ In- V+ V- OUT
B1 N020 0 V=V(Isense1)
A2 N015 N016 0 0 0 0 PWM1 0 SRFLOP
V§Clock2 N015 0 PULSE(0 2 0 {Ts/2} {Ts/2} 1n {Ts})
E4 PWM2G 0 PWM2_M 0 10
B2 N029 0 V=V(Isense2)
XU4 COMP N027 3.3V 0 Comparator2 level3a Avol=1Meg GBW=10Meg Slew=10Meg Ilimit=25m Rail=0 Vos=0 Phimargin=45 En=0 Enk=0 In=0 Ink=0 Rin=500Meg  ; UNIVERSALOPAMP3A, pins In+ In- V+ V- OUT
R9 N028 N027 1.6k
C6 Comparator2 N028 47n
C7 N027 Comparator2 2.2n
XU5 COMP N017 3.3V 0 Comparator1 level3a Avol=1Meg GBW=10Meg Slew=10Meg Ilimit=25m Rail=0 Vos=0 Phimargin=45 En=0 Enk=0 In=0 Ink=0 Rin=500Meg  ; UNIVERSALOPAMP3A, pins In+ In- V+ V- OUT
R10 N019 N017 1.6k
C8 Comparator1 N019 47n
C9 N017 Comparator1 2.2n
R11 GATE2 PWM2G 10
R12 GATE1 PWM1G 10
C10 N009 0 47µ
R13 COMP N024 1k
Vref1 Vref 0 PWL(0 1.5 2m 2)
XU6 Vsense OVP_ref N022 0 OVP level2 Avol=1Meg GBW=10Meg Slew=10Meg Ilimit=25m Rail=0 Vos=0 En=0 Enk=0 In=0 Ink=0 Rin=500Meg  ; pins In+ In- V+ V- OUT
D4 0 N024 UDZV6_2B
M3 COMP N023 0 0 Si4866DY
V2 OVP_ref 0 2.11
R14 N023 OVP 10
C11 COMP OVP 470p
V3 N022 0 20
R15 OVP Vsense 470k
R16 Isense1 N001 47
C12 Isense1 0 10n
C13 Isense2 0 10n
R17 Isense2 N005 47
B3 OCP1 0 V=if(V(SH1P,SH1N)>{Vth},5,0)
B4 OCP2 0 V=if(V(SH2P,SH2N)>{Vth},5,0)
B5 PWM1_M 0 V=if(V(OCP1)>1,0,V(PWM1))
B6 PWM2_M 0 V=if(V(OCP2)>1,0,V(PWM2))
V4 V_th 0 {Vth}
R19 in N009 20m
V5 in 0 {VIN}
C14 Vsense 0 100n
R18 out N011 120m
C15 N011 0 330µ
R20 out N012 30m
C16 N012 0 47µ
R21 out N013 30m
C17 N013 0 47µ
D5 COMP N014 1N750
R22 N017 N020 1k
R23 N027 N029 1k
R24 Vsense N014 2k
R25 N021 COMP 100
.model D D
.lib standard.dio
.model NMOS NMOS
.model PMOS PMOS
.lib standard.mos
;ac dec 200 1 1Meg
K L1 L2 0.7
* Comparator
* Current Loop Compensator
* Voltage Loop Compensator
.model Zener D(BV=4 IBV=2m)
* OVP
* OCP
* OVP
* Suply
.param Rsh=3m
.param Ipk=20
.param Vth={Rsh*Ipk}
;====================================================================
; ANALOG ACMC: VIN STEP + 2.8 -> 5.6 -> 2.8 OHM LOAD TRANSIENT
; Her VIN değeri için ayrı 25 ms transient analizi
;====================================================================
;---------------- TEMEL PARAMETRELER ----------------
.param Fs=100k
.param Ts=1/Fs
.param VOUT_NOM=28
.param TENABLE=1m
.param TSOFT=3m
.param TLOAD1=8m
.param TLOAD2=16m
.param TSTOP=25m
.param RHEAVY=2.8
.param RLIGHT=5.6
;---------------- INPUT-VOLTAGE STEP ----------------
; step 1 = 12 V
; step 2 = 14 V
; step 3 = 20 V
; step 4 = 24 V
.step param VIN list 12 14 20 24
; startup anahtar sözcüğü kullanılmıyor
.tran 0 {TSTOP} 0 {Ts/100} STARTUP
; Dalgalanma ölçümlerinde veri sıkıştırmasını kapat
.options plotwinsize=0
;====================================================================
; STEADY-STATE OUTPUT VALUES
;====================================================================
; İlk ağır yük durumu: 2.8 ohm, yük geçişinden hemen önce
.meas tran Vout_heavy_pre AVG V(out) FROM 7m TO 7.9m
; Hafif yük durumu: 5.6 ohm, ikinci geçişten hemen önce
.meas tran Vout_light_ss AVG V(out) FROM 15m TO 15.9m
; Son ağır yük durumu: 2.8 ohm
.meas tran Vout_heavy_post AVG V(out) FROM 24m TO 25m
.meas tran Vin_post AVG V(in) FROM 24m TO 25m
;====================================================================
; CONTROLLER STARTUP RESPONSE
; TENABLE=1 ms ile TLOAD1=8 ms arasındaki başlangıç cevabı
;====================================================================
.meas tran Vout_startup_peak MAX V(out) FROM {TENABLE} TO {TLOAD1}
; Ölçülen son değere göre aşım
.meas tran Startup_overshoot_pct PARAM
+ 100*max(Vout_startup_peak-Vout_heavy_pre,0)/Vout_heavy_pre
; 28 V nominal değere göre aşım
.meas tran Startup_overshoot_nom_pct PARAM
+ 100*max(Vout_startup_peak-VOUT_NOM,0)/VOUT_NOM
; İlk yük geçişinden önce, son değerin ±%2 bandına son giriş
; Ölçüm sonuçları süslü paranteze alınmamalıdır.
.meas tran T_startup_last WHEN
+ if(time<{TLOAD1},abs(V(out)-Vout_heavy_pre),0)
+ =0.02*Vout_heavy_pre
+ TD={TENABLE} CROSS=LAST
.meas tran Startup_settling_raw_ms PARAM
+ 1e3*(T_startup_last-TENABLE)
.meas tran Startup_tail_error MAX
+ abs(V(out)-Vout_heavy_pre)
+ FROM 7m TO 7.9m
.meas tran Startup_settled_ok PARAM
+ if(Startup_tail_error<0.02*Vout_heavy_pre,1,0)
.meas tran Startup_settling_ms PARAM
+ if(Startup_settled_ok,Startup_settling_raw_ms,-1)
; İlk ağır yükteki anahtarlama ripple'ı
.meas tran Ripple_heavy_pre_mV PP (1e3*V(out))
+ FROM 7.8m TO 7.9m
;====================================================================
; LOAD RELEASE: 2.8 OHM -> 5.6 OHM AT 8 ms
;====================================================================
.meas tran Vout_release_peak MAX V(out)
+ FROM {TLOAD1} TO {TLOAD2}
.meas tran Release_delta_V PARAM
+ max(Vout_release_peak-Vout_light_ss,0)
.meas tran Release_overshoot_pct PARAM
+ 100*max(Vout_release_peak-Vout_light_ss,0)/Vout_light_ss
; İkinci yük geçişinden önce ±%2 bandına son giriş
.meas tran T_release_last WHEN
+ if(time<{TLOAD2},abs(V(out)-Vout_light_ss),0)
+ =0.02*Vout_light_ss
+ TD={TLOAD1} CROSS=LAST
.meas tran Release_settling_raw_ms PARAM
+ 1e3*(T_release_last-TLOAD1)
.meas tran Release_tail_error MAX
+ abs(V(out)-Vout_light_ss)
+ FROM 15m TO 15.9m
.meas tran Release_settled_ok PARAM
+ if(Release_tail_error<0.02*Vout_light_ss,1,0)
.meas tran Release_settling_ms PARAM
+ if(Release_settled_ok,Release_settling_raw_ms,-1)
; Hafif yükte son 10 anahtarlama periyodu
.meas tran Ripple_light_mV PP (1e3*V(out))
+ FROM 15.8m TO 15.9m
;====================================================================
; LOAD APPLICATION: 5.6 OHM -> 2.8 OHM AT 16 ms
;====================================================================
.meas tran Vout_apply_min MIN V(out)
+ FROM {TLOAD2} TO {TSTOP}
.meas tran Apply_delta_V PARAM
+ max(Vout_heavy_post-Vout_apply_min,0)
.meas tran Apply_undershoot_pct PARAM
+ 100*max(Vout_heavy_post-Vout_apply_min,0)/Vout_heavy_post
.meas tran T_apply_last WHEN
+ abs(V(out)-Vout_heavy_post)
+ =0.02*Vout_heavy_post
+ TD={TLOAD2} CROSS=LAST
.meas tran Apply_settling_raw_ms PARAM
+ 1e3*(T_apply_last-TLOAD2)
.meas tran Apply_tail_error MAX
+ abs(V(out)-Vout_heavy_post)
+ FROM 24m TO 25m
.meas tran Apply_settled_ok PARAM
+ if(Apply_tail_error<0.02*Vout_heavy_post,1,0)
.meas tran Apply_settling_ms PARAM
+ if(Apply_settled_ok,Apply_settling_raw_ms,-1)
; Son ağır yükte son 10 anahtarlama periyodu
.meas tran Ripple_heavy_mV PP (1e3*V(out))
+ FROM 24.9m TO 25m
;====================================================================
; PHASE-CURRENT SHARING
; Son ağır yük durumunda ölçülür
;====================================================================
.meas tran IL1_avg AVG abs(I(L1))
+ FROM 24.9m TO 25m
.meas tran IL2_avg AVG abs(I(L2))
+ FROM 24.9m TO 25m
.meas tran IL1_ripple_pp PP I(L1)
+ FROM 24.9m TO 25m
.meas tran IL2_ripple_pp PP I(L2)
+ FROM 24.9m TO 25m
.meas tran IL1_peak MAX abs(I(L1))
+ FROM 24.9m TO 25m
.meas tran IL2_peak MAX abs(I(L2))
+ FROM 24.9m TO 25m
.meas tran Current_share_error_pct PARAM
+ 100*abs(IL1_avg-IL2_avg)/max((IL1_avg+IL2_avg)/2,1u)
;====================================================================
; INPUT CURRENT AND POWER-STAGE EFFICIENCY
; Son ağır yük durumunda ölçülür
;====================================================================
.meas tran Iin_avg AVG (-I(V5))
+ FROM 24.9m TO 25m
.meas tran Iin_ripple_pp PP I(V5)
+ FROM 24.9m TO 25m
.meas tran Pin_W AVG (-V(in)*I(V5))
+ FROM 24.9m TO 25m
.meas tran Pout_W AVG (V(out)*I(Load1))
+ FROM 24.9m TO 25m
.meas tran Efficiency_pct PARAM
+ 100*Pout_W/Pin_W
;====================================================================
; ACTUAL PWM DUTY RATIOS
;====================================================================
.meas tran Duty1 AVG if(V(PWM1_M)>1,1,0)
+ FROM 24.9m TO 25m
.meas tran Duty2 AVG if(V(PWM2_M)>1,1,0)
+ FROM 24.9m TO 25m
.meas tran Duty_avg PARAM
+ (Duty1+Duty2)/2
;====================================================================
; OVERCURRENT INDICATORS
; 0 V = etkinleşmedi, 5 V = en az bir kez etkinleşti
;====================================================================
.meas tran OCP1_max MAX V(OCP1)
+ FROM {TENABLE} TO {TSTOP}
.meas tran OCP2_max MAX V(OCP2)
+ FROM {TENABLE} TO {TSTOP}
.meas TRAN ripple sw mw PP (1e3*V(out)) FROM 9.9m TO 10m
;tran 25m
.meas tran Duty1 AVG if(V(GATE1)>1,1,0) FROM 24.9m TO 25m
.meas tran Duty2 AVG if(V(GATE2)>1,1,0) FROM 24.9m TO 25m
.lib UniversalOpAmp2.lib
.backanno
.end